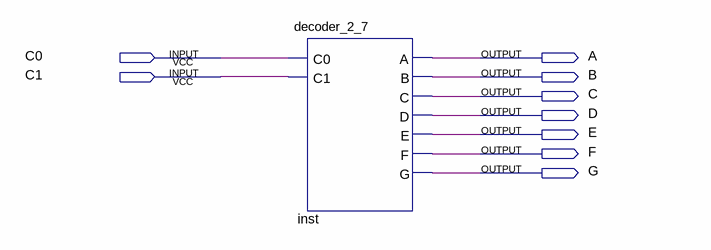
[diagram p0: schematic sheet]
// Quartus schematic task.bdf as structural Verilog: 1 symbols, 9 pins
module \task  (
  input  C0,
  input  C1,
  output A,
  output B,
  output C,
  output D,
  output E,
  output F,
  output G
);

  decoder_2_7 inst (.C0(C0), .C1(C1), .A(A), .B(B), .C(C), .D(D), .E(E), .F(F), .G(G));
endmodule
